# Altium project ARGUSPrjPcb.PrjPcb (part 2 of 2)

## Sheet USB.SchDoc: USB
size A4; DocumentNumber: 15; SheetNumber: 8; SheetTotal: 18
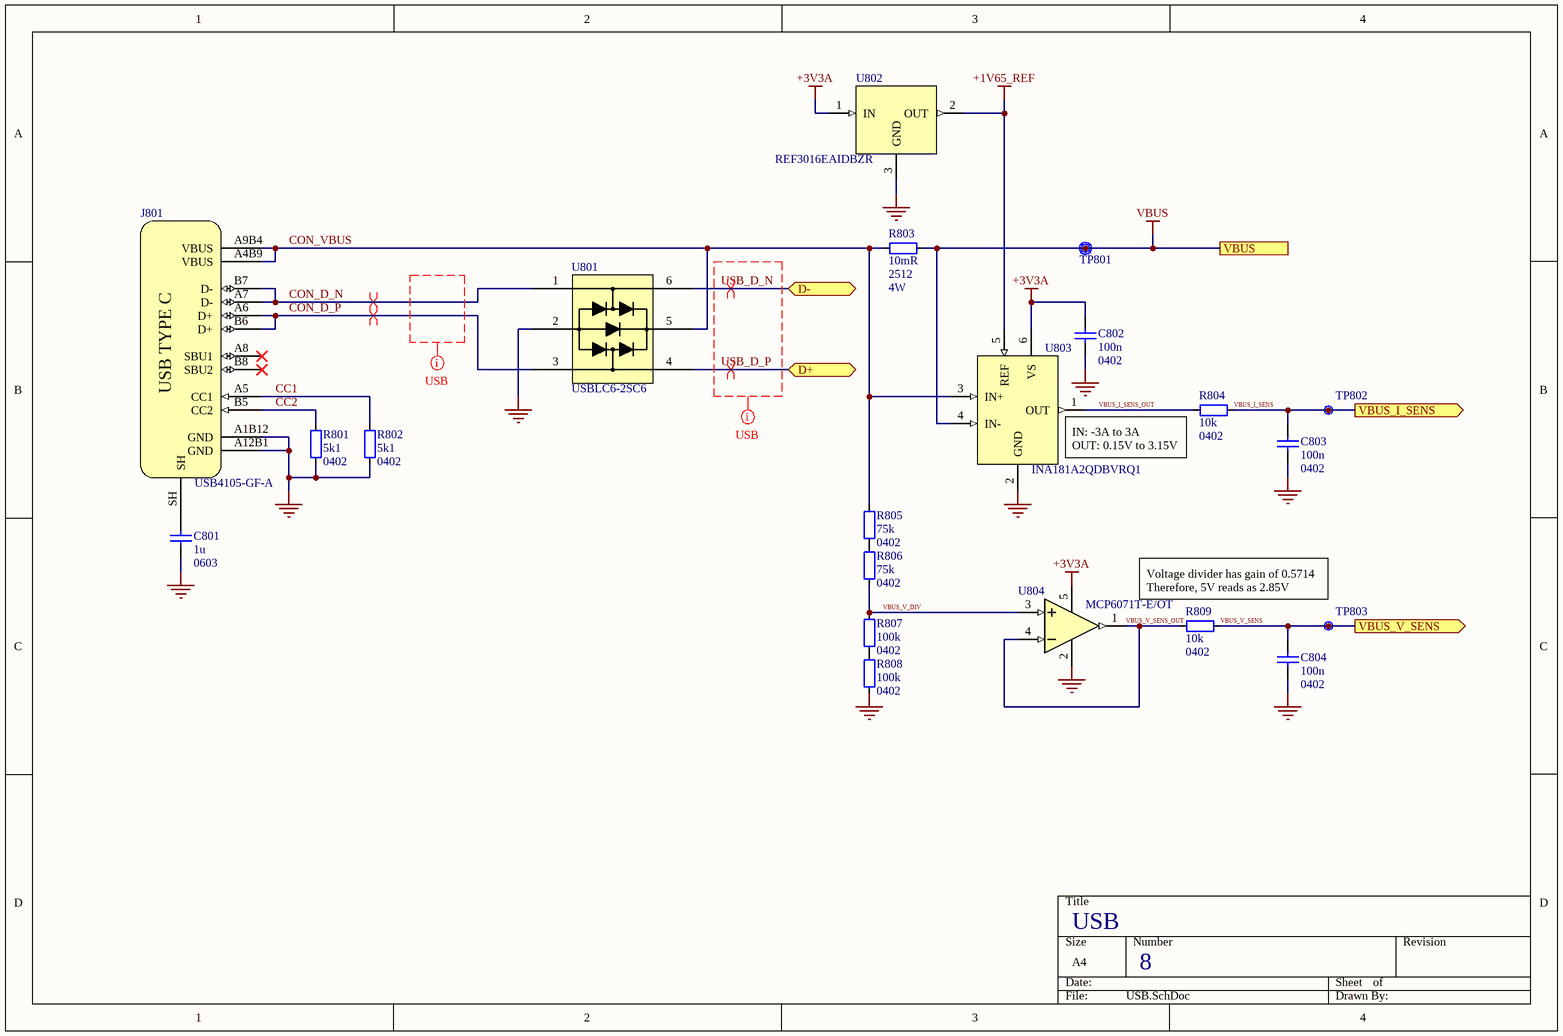
[diagram p9: USB.SchDoc]

### Parts
C801  1u  Footprint: 0603  [CAP_0603_B]
C802  100n  Footprint: 0402  [CAP_0402_B]
C803  100n  Footprint: 0402  [CAP_0402_B]
C804  100n  Footprint: 0402  [CAP_0402_B]
J801  USB4105-GF-A  [USB4105-GF-A]
R801  5k1  Footprint: 0402  [RES_0402_A]
R802  5k1  Footprint: 0402  [RES_0402_A]
R803  10mR  Footprint: 2512  Power: 4W  [VMS-R010-1.0-U]
R804  10k  Footprint: 0402  [RES_0402_A]
R805  75k  Footprint: 0402  [RES_0402_A]
R806  75k  Footprint: 0402  [RES_0402_A]
R807  100k  Footprint: 0402  [RES_0402_A]
R808  100k  Footprint: 0402  [RES_0402_A]
R809  10k  Footprint: 0402  [RES_0402_A]
TP801  Net  [Labelled Testpoint]  (value not drawn)
TP802  Net  [Unlabelled Testpoint]  (value not drawn)
TP803  Net  [Unlabelled Testpoint]  (value not drawn)
U801  USBLC6-2SC6  [USBLC6-2SC6]
U802  REF3016EAIDBZR  [REF3016EAIDBZR]
U803  INA181A2QDBVRQ1  [INA181A2QDBVRQ1]
U804  MCP6071T-E/OT  [MCP6071T-E/OT]

### Ports
D+ (bidir, see Top_Level[3B]), D- (bidir, see Top_Level[3B]), VBUS (see Top_Level[3B], Battery_Charging[1C]), VBUS_I_SENS (out, see Top_Level[3B], Power_Sense[1C]), VBUS_V_SENS (out, see Top_Level[3B], Power_Sense[1C])

### Nets
+1V65_REF: U802.2(OUT) U803.5(REF)
+3V3A: C802.1 U802.1(IN) U803.6(VS) U804.5(VDD)
GND: C801.2 C802.2 C803.2 C804.2 J801.A1B12(GND) J801.A12B1(GND) R801.2(a) R802.2(a) R808.2(a) U801.2(GND) U802.3(GND) U803.2(GND) U804.2(VSS)
VBUS: R803.2(a) TP801.1 U803.4(IN-) ; port VBUS
CC1: J801.A5(CC1) R802.1(a)
CC2: J801.B5(CC2) R801.1(a)
CON_D_N: J801.A7(D-) J801.B7(D-) U801.1(IO1)
CON_D_P: J801.A6(D+) J801.B6(D+) U801.3(IO2)
CON_VBUS: J801.A4B9(VBUS) J801.A9B4(VBUS) R803.1(a) R805.2(a) U801.5(VBUS) U803.3(IN+)
USB_D_N: U801.6(IO1) ; port D-
USB_D_P: U801.4(IO2) ; port D+
VBUS_I_SENS: C803.1 R804.2(a) TP802.1 ; port VBUS_I_SENS
VBUS_I_SENS_OUT: R804.1(a) U803.1(OUT)
VBUS_V_DIV: R806.1(a) R807.1(a) U804.3(VIN+)
VBUS_V_SENS: C804.1 R809.2(a) TP803.1 ; port VBUS_V_SENS
VBUS_V_SENS_OUT: R809.1(a) U804.1(VOUT) U804.4(VIN-)
NetC801_1: C801.1 J801.SH
NetR805_1: R805.1(a) R806.2(a)
NetR807_2: R807.2(a) R808.1(a)

Not connected (* = marked no-connect by the designer): J801 A8(SBU1)* B8(SBU2)*

### Layout directives
differential pair: CON_D_N, CON_D_P, USB_D_N, USB_D_P
net class USB: (no net found under the mark), USB_D_N, USB_D_P

### Notes on the sheet
- (near U803) IN: -3A to 3A
  OUT: 0.15V to 3.15V
- Voltage divider has gain of 0.5714
  Therefore, 5V reads as 2.85V
- (in symbol USB4105-GF-A) USB TYPE C

### Library data of the parts
C801 = CAP_0603: 0603 SMD Capacitor
C802-C804 = CAP_0402: 0402 SMD Capacitor
J801 = USB4105-GF-A: USB-C (USB TYPE-C) USB 2.0 Receptacle Connector 24 (16+8 Dummy) Position Surface Mount, Right Angle; Through Hole; Supplier 1: Future Electronics; Supplier Part Number 1: USB4105-GF-A
R801 R802 R804-R809 = RES_0402: 0402 SMD Resistor
R803 = RES_GENERIC: VMS-R010-1.0-U; Supplier 1: DigiKey; Supplier Part Number 1: 4423-VMS-R010-1.0-UDKR-ND
TP801 = Labelled Testpoint: Symbol for a labelled testpoint
TP802 TP803 = Unlabelled Testpoint: Symbol for an unlabelled testpoint
U801 = USBLC6-2SC6: 17V Clamp 5A (8/20µs) Ipp Tvs Diode Surface Mount SOT-23-6; Supplier 1: Arrow Electronics; Supplier Part Number 1: USBLC6-2SC6
U802 = REF3016EAIDBZR: Series Voltage Reference IC Fixed 1.65V V ±0.1% 25 mA SOT-23-3; Supplier 1: DigiKey; Supplier Part Number 1: 296-REF3016EAIDBZRCT-ND
U803 = INA181A2QDBVRQ1: as U1401 on sheet Battery_Charging; Supplier 1: DigiKey; Supplier Part Number 1: 296-INA181A2QDBVRQ1CT-ND
U804 = MCP6071T-E/OT: as U1404 on sheet Battery_Charging; Supplier 1: Arrow Electronics; Supplier Part Number 1: MCP6071T-E/OT

## Sheet EEPROM.SchDoc: EEPROM
size A4; DocumentNumber: 13; SheetNumber: 11; SheetTotal: 16
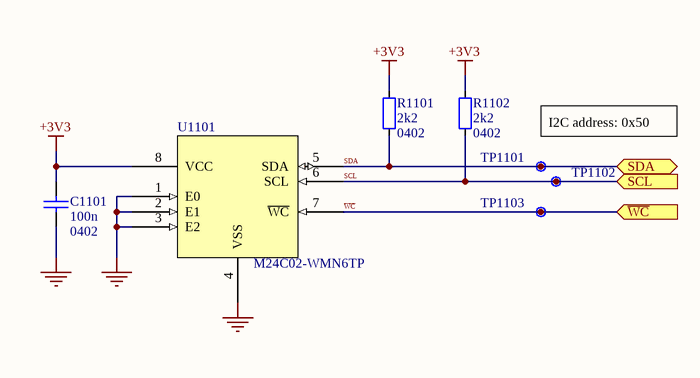
[diagram p10: EEPROM.SchDoc]

### Parts
C1101  100n  Footprint: 0402  [CAP_0402_B]
R1101  2k2  Footprint: 0402  [RES_0402_A]
R1102  2k2  Footprint: 0402  [RES_0402_A]
TP1101  Net  [Unlabelled Testpoint]  (value not drawn)
TP1102  Net  [Unlabelled Testpoint]  (value not drawn)
TP1103  Net  [Unlabelled Testpoint]  (value not drawn)
U1101  M24C02-WMN6TP  [M24C02-WMN6TP]

### Ports
SCL (in, see Top_Level[3D]), SDA (bidir, see Top_Level[3D]), ~{WC} (in, see Top_Level[3D])

### Nets
+3V3: C1101.1 R1101.1(a) R1102.1(a) U1101.8(VCC)
GND: C1101.2 U1101.1(E0) U1101.2(E1) U1101.3(E2) U1101.4(VSS)
SCL: R1102.2(a) TP1102.1 U1101.6(SCL) ; port SCL  [project net EEPROM_SCL]
SDA: R1101.2(a) TP1101.1 U1101.5(SDA) ; port SDA  [project net EEPROM_SDA]
~{WC}: TP1103.1 U1101.7(~{WC}) ; port ~{WC}  [project net EEPROM_~{WC}]

### Notes on the sheet
- I2C address: 0x50

### Library data of the parts
C1101 = CAP_0402: 0402 SMD Capacitor
R1101 R1102 = RES_0402: 0402 SMD Resistor
TP1101-TP1103 = Unlabelled Testpoint: Symbol for an unlabelled testpoint
U1101 = M24C02-WMN6TP: IC EEPROM 2KBIT I2C 400KHZ 8SOIC; Supplier 1: Arrow Electronics; Supplier Part Number 1: M24C02-WMN6TP

## Sheet RTC.SchDoc: RTC
size A4; DocumentNumber: 12; SheetNumber: 10; SheetTotal: 16
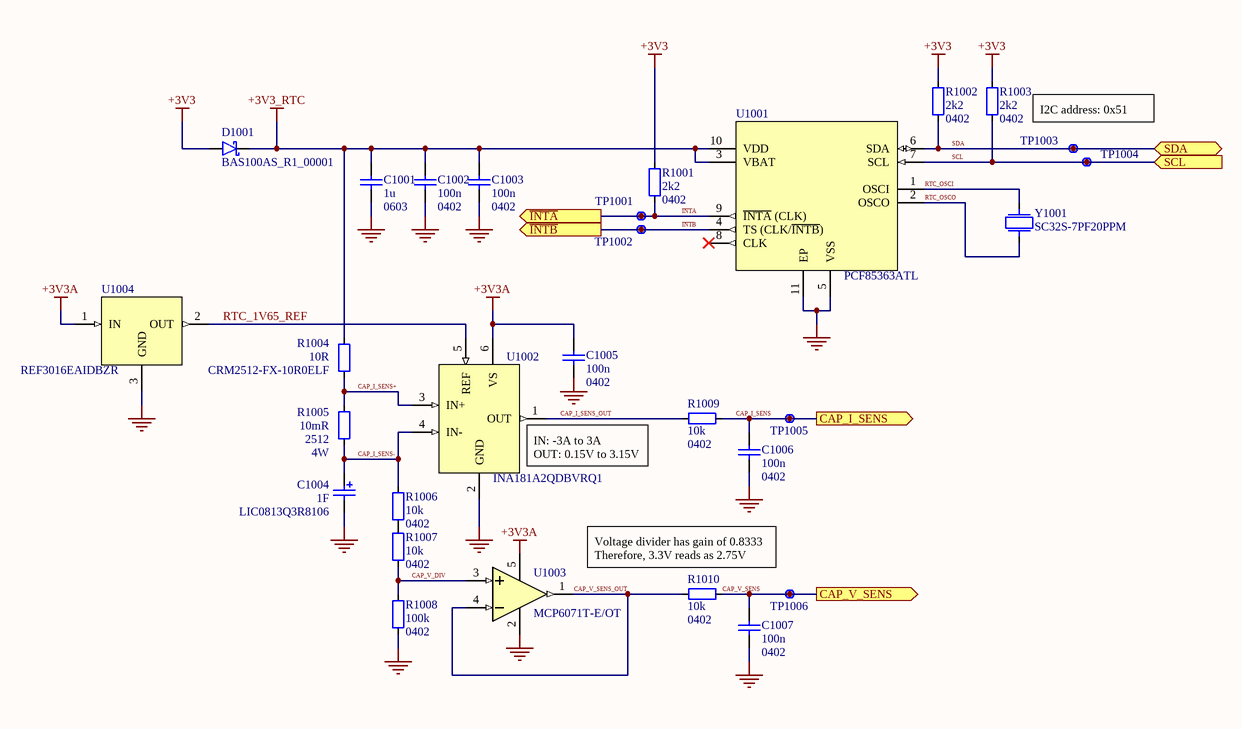
[diagram p11: RTC.SchDoc]

### Parts
C1001  1u  Footprint: 0603  [CAP_0603_B]
C1002  100n  Footprint: 0402  [CAP_0402_B]
C1003  100n  Footprint: 0402  [CAP_0402_B]
C1004  1F  [LIC0813Q3R8106]
C1005  100n  Footprint: 0402  [CAP_0402_B]
C1006  100n  Footprint: 0402  [CAP_0402_B]
C1007  100n  Footprint: 0402  [CAP_0402_B]
D1001  BAS100AS_R1_00001  [BAS100AS_R1_00001]
R1001  2k2  Footprint: 0402  [RES_0402_A]
R1002  2k2  Footprint: 0402  [RES_0402_A]
R1003  2k2  Footprint: 0402  [RES_0402_A]
R1004  10R  [CRM2512-FX-10R0ELF]
R1005  10mR  Footprint: 2512  Power: 4W  [VMS-R010-1.0-U]
R1006  10k  Footprint: 0402  [RES_0402_A]
R1007  10k  Footprint: 0402  [RES_0402_A]
R1008  100k  Footprint: 0402  [RES_0402_A]
R1009  10k  Footprint: 0402  [RES_0402_A]
R1010  10k  Footprint: 0402  [RES_0402_A]
TP1001  Net  [Unlabelled Testpoint]  (value not drawn)
TP1002  Net  [Unlabelled Testpoint]  (value not drawn)
TP1003  Net  [Unlabelled Testpoint]  (value not drawn)
TP1004  Net  [Unlabelled Testpoint]  (value not drawn)
TP1005  Net  [Unlabelled Testpoint]  (value not drawn)
TP1006  Net  [Unlabelled Testpoint]  (value not drawn)
U1001  PCF85363ATL  [PCF85363ATL/AX]
U1002  INA181A2QDBVRQ1  [INA181A2QDBVRQ1]
U1003  MCP6071T-E/OT  [MCP6071T-E/OT]
U1004  REF3016EAIDBZR  [REF3016EAIDBZR]
Y1001  SC32S-7PF20PPM  [SC32S-7PF20PPM]

### Ports
CAP_I_SENS (out, see Top_Level[3C], MCU[2D]), CAP_V_SENS (out, see Top_Level[3C], MCU[2D]), SCL (in, see Top_Level[3B]), SDA (bidir, see Top_Level[3B]), ~{INTA} (out, see Top_Level[3B]), ~{INTB} (out, see Top_Level[3C])

### Nets
+3V3: D1001.1(a) R1001.1(a) R1002.1(a) R1003.1(a)
+3V3_RTC: C1001.1 C1002.1 C1003.1 D1001.2 R1004.1(a) U1001.3(VBAT) U1001.10(VDD)
+3V3A: C1005.1 U1002.6(VS) U1003.5(VDD) U1004.1(IN)
GND: C1001.2 C1002.2 C1003.2 C1004.2 C1005.2 C1006.2 C1007.2 R1008.2(a) U1001.5(VSS) U1001.11(EP) U1002.2(GND) U1003.2(VSS) U1004.3(GND)
CAP_I_SENS: C1006.1 R1009.2(a) TP1005.1 ; port CAP_I_SENS
CAP_I_SENS+: R1004.2(a) R1005.2(a) U1002.3(IN+)
CAP_I_SENS-: C1004.1 R1005.1(a) R1006.1(a) U1002.4(IN-)
CAP_I_SENS_OUT: R1009.1(a) U1002.1(OUT)
CAP_V_DIV: R1007.2(a) R1008.1(a) U1003.3(VIN+)
CAP_V_SENS: C1007.1 R1010.2(a) TP1006.1 ; port CAP_V_SENS
CAP_V_SENS_OUT: R1010.1(a) U1003.1(VOUT) U1003.4(VIN-)
~{INT}A: R1001.2(a) TP1001.1 U1001.9(~{INTA}_(CLK)) ; port ~{INTA}
~{INT}B: TP1002.1 U1001.4(TS_(CLK/~{INTB})) ; port ~{INTB}
RTC_1V65_REF: U1002.5(REF) U1004.2(OUT)
RTC_OSCI: U1001.1(OSCI) Y1001.2
RTC_OSCO: U1001.2(OSCO) Y1001.1
SCL: R1003.2(a) TP1004.1 U1001.7(SCL) ; port SCL  [project net RTC_SCL]
SDA: R1002.2(a) TP1003.1 U1001.6(SDA) ; port SDA  [project net RTC_SDA]
NetR1006_2: R1006.2(a) R1007.1(a)

Not connected (* = marked no-connect by the designer): U1001 8(CLK)*

### Notes on the sheet
- I2C address: 0x51
- (near U1002) IN: -3A to 3A
  OUT: 0.15V to 3.15V
- Voltage divider has gain of 0.8333
  Therefore, 3.3V reads as 2.75V

### Library data of the parts
C1001 = CAP_0603: 0603 SMD Capacitor
C1002 C1003 C1005-C1007 = CAP_0402: 0402 SMD Capacitor
C1004 = CAP_GENERIC_POLARISED: 10 F (EDLC) Supercapacitor 3.8 V Radial, Can 510mOhm @ 1kHz 1000 Hrs @ 85°C; Part Number: LIC0813Q3R8106
D1001 = BAS100AS_R1_00001: DIODE SCHOTTKY 100V 500MA SOD123; Supplier 1: DigiKey; Supplier Part Number 1: 3757-BAS100AS_R1_00001CT-ND
R1001-R1003 R1006-R1010 = RES_0402: 0402 SMD Resistor
R1004 = RES_GENERIC: Generic resistor symbol; Part Number: CRM2512-FX-10R0ELF
R1005 = RES_GENERIC: VMS-R010-1.0-U; Supplier 1: DigiKey; Supplier Part Number 1: 4423-VMS-R010-1.0-UDKR-ND
TP1001-TP1006 = Unlabelled Testpoint: Symbol for an unlabelled testpoint
U1001 = PCF85363ATL: IC RTC CLK/CALENDAR I2C 10DFN; Supplier 1: Arrow Electronics; Supplier Part Number 1: PCF85363ATL/AX
U1002 = INA181A2QDBVRQ1: Current Sense Amplifier 1 Circuit Rail-to-Rail SOT-23-6; Supplier 1: DigiKey; Supplier Part Number 1: 296-INA181A2QDBVRQ1CT-ND
U1003 = MCP6071T-E/OT: Standard (General Purpose) Amplifier 1 Circuit Rail-to-Rail SOT-23-5; Supplier 1: Arrow Electronics; Supplier Part Number 1: MCP6071T-E/OT
U1004 = REF3016EAIDBZR: Series Voltage Reference IC Fixed 1.65V V ±0.1% 25 mA SOT-23-3; Supplier 1: DigiKey; Supplier Part Number 1: 296-REF3016EAIDBZRCT-ND
Y1001 = SC32S-7PF20PPM: 32.768 kHz ±20ppm Crystal 7pF 70 kOhms 2-SMD, No Lead; Supplier 1: Arrow Electronics; Supplier Part Number 1: SC32S-7PF20PPM

## Sheet SD_Card.SchDoc: SD Card
size A4; DocumentNumber: 14; SheetNumber: 12; SheetTotal: 16
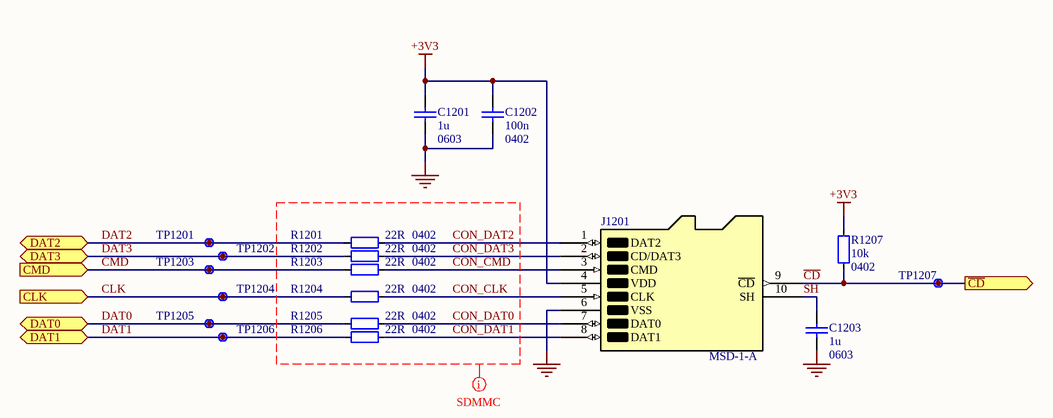
[diagram p12: SD_Card.SchDoc]

### Parts
C1201  1u  Footprint: 0603  [CAP_0603_B]
C1202  100n  Footprint: 0402  [CAP_0402_B]
C1203  1u  Footprint: 0603  [CAP_0603_B]
J1201  MSD-1-A  [MSD-1-A]
R1201  22R  Footprint: 0402  [RES_0402_A]
R1202  22R  Footprint: 0402  [RES_0402_A]
R1203  22R  Footprint: 0402  [RES_0402_A]
R1204  22R  Footprint: 0402  [RES_0402_A]
R1205  22R  Footprint: 0402  [RES_0402_A]
R1206  22R  Footprint: 0402  [RES_0402_A]
R1207  10k  Footprint: 0402  [RES_0402_A]
TP1201  Net  [Unlabelled Testpoint]  (value not drawn)
TP1202  Net  [Unlabelled Testpoint]  (value not drawn)
TP1203  Net  [Unlabelled Testpoint]  (value not drawn)
TP1204  Net  [Unlabelled Testpoint]  (value not drawn)
TP1205  Net  [Unlabelled Testpoint]  (value not drawn)
TP1206  Net  [Unlabelled Testpoint]  (value not drawn)
TP1207  Net  [Unlabelled Testpoint]  (value not drawn)

### Ports
CLK (in, see Top_Level[3C]), CMD (in, see Top_Level[3C]), DAT0 (bidir, see Top_Level[3C]), DAT1 (bidir, see Top_Level[3C]), DAT2 (bidir, see Top_Level[3C]), DAT3 (bidir, see Top_Level[3C]), ~{CD} (out, see Top_Level[3C])

### Nets
+3V3: C1201.1 C1202.1 J1201.4(VDD) R1207.1(a)
GND: C1201.2 C1202.2 C1203.2 J1201.6(VSS)
~{CD}: J1201.9(~{CD}) R1207.2(a) TP1207.1 ; port ~{CD}
CLK: R1204.1(a) TP1204.1 ; port CLK
CMD: R1203.1(a) TP1203.1 ; port CMD
CON_CLK: J1201.5(CLK) R1204.2(a)
CON_CMD: J1201.3(CMD) R1203.2(a)
CON_DAT0: J1201.7(DAT0) R1205.2(a)
CON_DAT1: J1201.8(DAT1) R1206.2(a)
CON_DAT2: J1201.1(DAT2) R1201.2(a)
CON_DAT3: J1201.2(CD/DAT3) R1202.2(a)
DAT0: R1205.1(a) TP1205.1 ; port DAT0
DAT1: R1206.1(a) TP1206.1 ; port DAT1
DAT2: R1201.1(a) TP1201.1 ; port DAT2
DAT3: R1202.1(a) TP1202.1 ; port DAT3
SH: C1203.1 J1201.10(SH)

### Layout directives
net class SDMMC: CON_CLK, CON_CMD, CON_DAT0, CON_DAT1, CON_DAT2, CON_DAT3

### Library data of the parts
C1201 C1203 = CAP_0603: 0603 SMD Capacitor
C1202 = CAP_0402: 0402 SMD Capacitor
J1201 = MSD-1-A: CONN MICROSD CARD R/A SMD; Supplier 1: Arrow Electronics; Supplier Part Number 1: MSD-1-A
R1201-R1207 = RES_0402: 0402 SMD Resistor
TP1201-TP1207 = Unlabelled Testpoint: Symbol for an unlabelled testpoint

## Sheet 5V_Regulator.SchDoc: 5V Regulator
size A4; DocumentNumber: 10; SheetNumber: 15; SheetTotal: 16
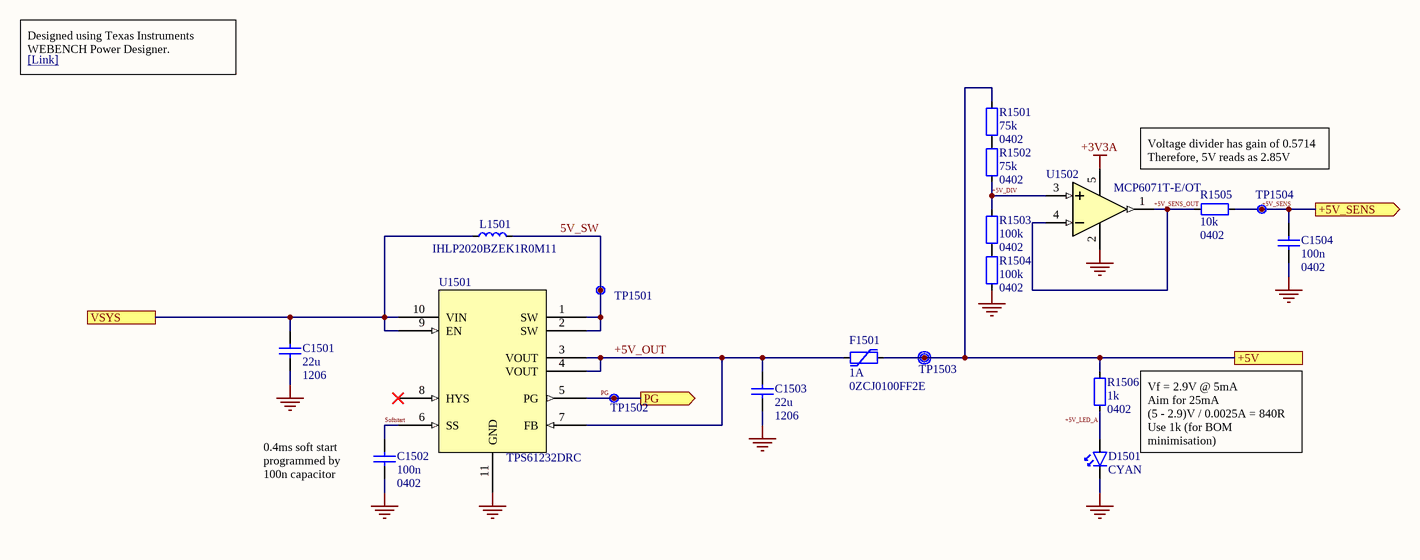
[diagram p13: 5V_Regulator.SchDoc]

### Parts
C1501  22u  Footprint: 1206  [CAP_1206_B]
C1502  100n  Footprint: 0402  [CAP_0402_B]
C1503  22u  Footprint: 1206  [CAP_1206_B]
C1504  100n  Footprint: 0402  [CAP_0402_B]
D1501  CYAN  [SMLD12E3N1WT86]
F1501  1A  [0ZCJ0100FF2E]
L1501  IHLP2020BZEK1R0M11  [IHLP2020BZEK1R0M11]
R1501  75k  Footprint: 0402  [RES_0402_A]
R1502  75k  Footprint: 0402  [RES_0402_A]
R1503  100k  Footprint: 0402  [RES_0402_A]
R1504  100k  Footprint: 0402  [RES_0402_A]
R1505  10k  Footprint: 0402  [RES_0402_A]
R1506  1k  Footprint: 0402  [RES_0402_A]
TP1501  Net  [Unlabelled Testpoint]  (value not drawn)
TP1502  Net  [Unlabelled Testpoint]  (value not drawn)
TP1503  Net  [Labelled Testpoint]  (value not drawn)
TP1504  Net  [Unlabelled Testpoint]  (value not drawn)
U1501  TPS61232DRC  [TPS61232DRCR]
U1502  MCP6071T-E/OT  [MCP6071T-E/OT]

### Ports
+5V (see Top_Level[4B]), +5V_SENS (out, see Top_Level[4B], MCU[2D]), PG (out, see Top_Level[4B]), VSYS (see Top_Level[4B], 3V3_Regulators[1A], Battery_Charging[4C])

### Nets
+3V3A: U1502.5(VDD)
+5V: F1501.2(a) R1501.2(a) R1506.1(a) TP1503.1 ; port +5V
GND: C1501.2 C1502.2 C1503.2 C1504.2 D1501.2 R1504.2(a) U1501.11(GND) U1502.2(VSS)
VSYS: C1501.1 L1501.2(a) U1501.9(EN) U1501.10(VIN) ; port VSYS
5V_SW: L1501.1(a) TP1501.1 U1501.1(SW) U1501.2(SW)
+5V_DIV: R1502.1(a) R1503.1(a) U1502.3(VIN+)
+5V_LED_A: D1501.1 R1506.2(a)
+5V_OUT: C1503.1 F1501.1(a) U1501.3(VOUT) U1501.4(VOUT) U1501.7(FB)
+5V_SENS: C1504.1 R1505.2(a) TP1504.1 ; port +5V_SENS
+5V_SENS_OUT: R1505.1(a) U1502.1(VOUT) U1502.4(VIN-)
PG: TP1502.1 U1501.5(PG) ; port PG
Softstart: C1502.1 U1501.6(SS)
NetR1501_1: R1501.1(a) R1502.2(a)
NetR1503_2: R1503.2(a) R1504.1(a)

Not connected (* = marked no-connect by the designer): U1501 8(HYS)*

### Notes on the sheet
- Designed using Texas Instruments WEBENCH Power Designer.
- [Link] <https://webench.ti.com/appinfo/webench/scripts/SDP.cgi?ID=AD256845D1460620>
- Voltage divider has gain of 0.5714
  Therefore, 5V reads as 2.85V
- Vf = 2.9V @ 5mA
  Aim for 25mA
  (5 - 2.9)V / 0.0025A = 840R
  Use 1k (for BOM minimisation)
- (near C1502) 0.4ms soft start programmed by 100n capacitor

### Library data of the parts
C1501 C1503 = CAP_1206: 1206 SMD Capacitor
C1502 C1504 = CAP_0402: 0402 SMD Capacitor
D1501 = LED_Generic: Part Number: SMLD12E3N1WT86; Supplier 1: DigiKey; Supplier Part Number 1: SMLD12E3N1WT86CT-ND
F1501 = FUSE_GENERIC: Generic Fuse Symbol; Part Number: 0ZCJ0100FF2E; Supplier 1: Avnet; Supplier Part Number 1: 48AC8418
L1501 = IND_GENERIC: 1 µH Shielded Molded Inductor 7.5 A 18.1mOhm Max Nonstandard; Supplier 1: Arrow Electronics; Supplier Part Number 1: IHLP2020BZER1R0M11
R1501-R1506 = RES_0402: 0402 SMD Resistor
TP1501 TP1502 TP1504 = Unlabelled Testpoint: Symbol for an unlabelled testpoint
TP1503 = Labelled Testpoint: Symbol for a labelled testpoint
U1501 = TPS61232DRC: Boost Switching Regulator IC Positive Fixed 5V 1 Output 5A (Switch) 10-VFDFN Exposed Pad; Supplier 1: DigiKey; Supplier Part Number 1: 296-44498-6-ND
U1502 = MCP6071T-E/OT: as U1003 on sheet RTC; Supplier 1: Arrow Electronics; Supplier Part Number 1: MCP6071T-E/OT

## Sheet 3V3_Regulators.SchDoc: 3V3 Regulator
size A4; DocumentNumber: 11; SheetNumber: 16; SheetTotal: 17
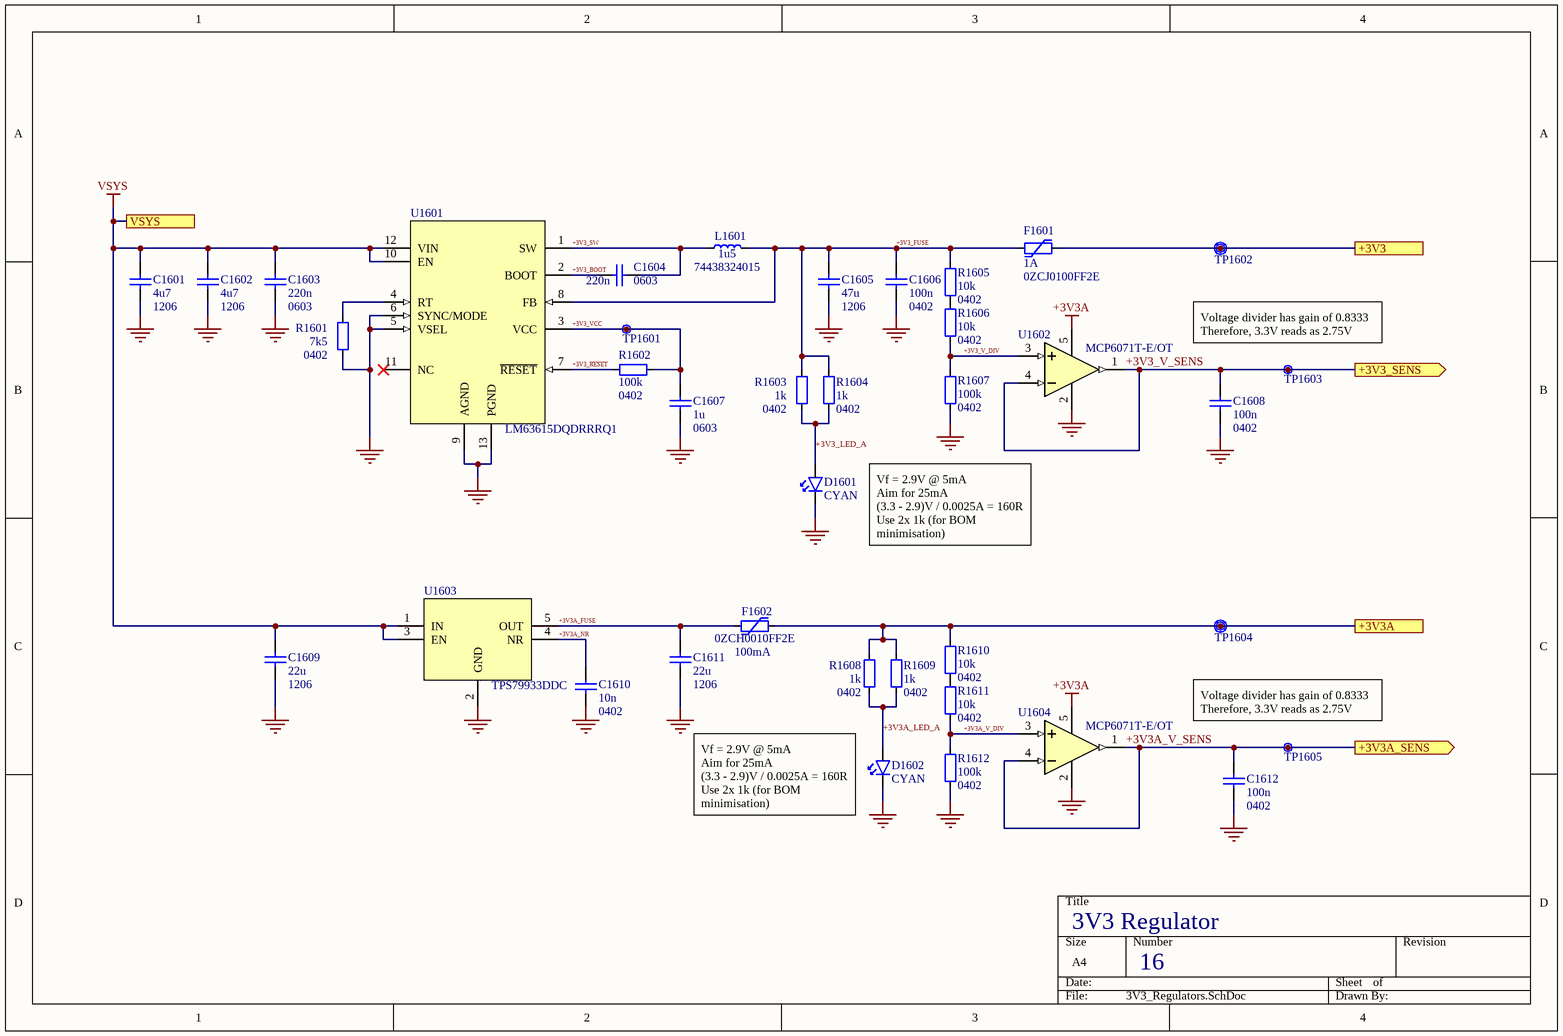
[diagram p14: 3V3_Regulators.SchDoc]

### Parts
C1601  4u7  Footprint: 1206  [CAP_1206_B]
C1602  4u7  Footprint: 1206  [CAP_1206_B]
C1603  220n  Footprint: 0603  [CAP_0603_B]
C1604  220n  Footprint: 0603  [CAP_0603_B]
C1605  47u  Footprint: 1206  [CAP_1206_B]
C1606  100n  Footprint: 0402  [CAP_0402_B]
C1607  1u  Footprint: 0603  [CAP_0603_B]
C1608  100n  Footprint: 0402  [CAP_0402_B]
C1609  22u  Footprint: 1206  [CAP_1206_B]
C1610  10n  Footprint: 0402  [CAP_0402_B]
C1611  22u  Footprint: 1206  [CAP_1206_B]
C1612  100n  Footprint: 0402  [CAP_0402_B]
D1601  CYAN  [SMLD12E3N1WT86]
D1602  CYAN  [SMLD12E3N1WT86]
F1601  1A  [0ZCJ0100FF2E]
F1602  100mA  [0ZCH0010FF2E]
L1601  1u5  [74438324015]
R1601  7k5  Footprint: 0402  [RES_0402_A]
R1602  100k  Footprint: 0402  [RES_0402_A]
R1603  1k  Footprint: 0402  [RES_0402_A]
R1604  1k  Footprint: 0402  [RES_0402_A]
R1605  10k  Footprint: 0402  [RES_0402_A]
R1606  10k  Footprint: 0402  [RES_0402_A]
R1607  100k  Footprint: 0402  [RES_0402_A]
R1608  1k  Footprint: 0402  [RES_0402_A]
R1609  1k  Footprint: 0402  [RES_0402_A]
R1610  10k  Footprint: 0402  [RES_0402_A]
R1611  10k  Footprint: 0402  [RES_0402_A]
R1612  100k  Footprint: 0402  [RES_0402_A]
TP1601  Net  [Unlabelled Testpoint]  (value not drawn)
TP1602  Net  [Labelled Testpoint]  (value not drawn)
TP1603  Net  [Unlabelled Testpoint]  (value not drawn)
TP1604  Net  [Labelled Testpoint]  (value not drawn)
TP1605  Net  [Unlabelled Testpoint]  (value not drawn)
U1601  LM63615DQDRRRQ1  [LM63615DQDRRRQ1]
U1602  MCP6071T-E/OT  [MCP6071T-E/OT]
U1603  TPS79933DDC  [TPS79933DDCR]
U1604  MCP6071T-E/OT  [MCP6071T-E/OT]

### Ports
+3V3 (see Top_Level[4C]), +3V3_SENS (out, see Top_Level[4C], Power_Sense[1C]), +3V3A (see Top_Level[4C]), +3V3A_SENS (out, see Top_Level[4C], Power_Sense[1C]), VSYS (see Top_Level[4C], 5V_Regulator[1B], Battery_Charging[4C])

### Nets
+3V3: F1601.2(a) TP1602.1 ; port +3V3
+3V3A: F1602.2(a) R1608.1(a) R1609.1(a) R1610.1(a) TP1604.1 U1602.5(VDD) U1604.5(VDD) ; port +3V3A
GND: C1601.2 C1602.2 C1603.2 C1605.2 C1606.2 C1607.2 C1608.2 C1609.2 C1610.2 C1611.2 C1612.2 D1601.2 D1602.2 R1601.2(a) R1607.2(a) R1612.2(a) U1601.5(VSEL) U1601.6(SYNC/MODE) U1601.9(AGND) U1601.13(PGND) U1602.2(VSS) U1603.2(GND) U1604.2(VSS)
VSYS: C1601.1 C1602.1 C1603.1 C1609.1 U1601.10(EN) U1601.12(VIN) U1603.1(IN) U1603.3(EN) ; port VSYS
+3V3_BOOT: C1604.1 U1601.2(BOOT)
+3V3_FUSE: C1605.1 C1606.1 F1601.1(a) L1601.1(a) R1603.1(a) R1604.1(a) R1605.1(a) U1601.8(FB)
+3V3_LED_A: D1601.1 R1603.2(a) R1604.2(a)
+3V3_~{RESET}: R1602.1(a) U1601.7(~{RESET})
+3V3_SW: C1604.2 L1601.2(a) U1601.1(SW)
+3V3_V_DIV: R1606.2(a) R1607.1(a) U1602.3(VIN+)
+3V3_V_SENS: C1608.1 TP1603.1 U1602.1(VOUT) U1602.4(VIN-) ; port +3V3_SENS
+3V3_VCC: C1607.1 R1602.2(a) TP1601.1 U1601.3(VCC)
+3V3A_FUSE: C1611.1 F1602.1(a) U1603.5(OUT)
+3V3A_LED_A: D1602.1 R1608.2(a) R1609.2(a)
+3V3A_NR: C1610.1 U1603.4(NR)
+3V3A_V_DIV: R1611.2(a) R1612.1(a) U1604.3(VIN+)
+3V3A_V_SENS: C1612.1 TP1605.1 U1604.1(VOUT) U1604.4(VIN-) ; port +3V3A_SENS
NetR1601_1: R1601.1(a) U1601.4(RT)
NetR1605_2: R1605.2(a) R1606.1(a)
NetR1610_2: R1610.2(a) R1611.1(a)

Not connected (* = marked no-connect by the designer): U1601 11(NC)*

### Notes on the sheet
- (near TP1603) Voltage divider has gain of 0.8333
  Therefore, 3.3V reads as 2.75V
- Vf = 2.9V @ 5mA
  Aim for 25mA
  (3.3 - 2.9)V / 0.0025A = 160R
  Use 2x 1k (for BOM minimisation)
- (near TP1605) Voltage divider has gain of 0.8333
  Therefore, 3.3V reads as 2.75V
- (near D1602) Vf = 2.9V @ 5mA
  Aim for 25mA
  (3.3 - 2.9)V / 0.0025A = 160R
  Use 2x 1k (for BOM minimisation)

### Library data of the parts
C1601 C1602 C1605 C1609 C1611 = CAP_1206: 1206 SMD Capacitor
C1603 C1604 C1607 = CAP_0603: 0603 SMD Capacitor
C1606 C1608 C1610 C1612 = CAP_0402: 0402 SMD Capacitor
D1601 D1602 = LED_Generic: Part Number: SMLD12E3N1WT86; Supplier 1: DigiKey; Supplier Part Number 1: SMLD12E3N1WT86CT-ND
F1601 F1602 = FUSE_GENERIC: Generic Fuse Symbol; Supplier 1: Avnet
  F1601: Part Number: 0ZCJ0100FF2E; Supplier Part Number 1: 48AC8418
  F1602: Part Number: 0ZCH0010FF2E; Supplier Part Number 1: 48AC8402
L1601 = IND_GENERIC: Generic inductor symbol; Part Number: 74438324015
R1601-R1612 = RES_0402: 0402 SMD Resistor
TP1601 TP1603 TP1605 = Unlabelled Testpoint: Symbol for an unlabelled testpoint
TP1602 TP1604 = Labelled Testpoint: Symbol for a labelled testpoint
U1601 = LM63615DQDRRRQ1: Buck Switching Regulator IC Positive Adjustable 1V 1 Output 1.5A 12-WFDFN Exposed Pad; Supplier 1: DigiKey; Supplier Part Number 1: 296-LM63615DQDRRRQ1DKR-ND
U1602 U1604 = MCP6071T-E/OT: as U1003 on sheet RTC; Supplier 1: Arrow Electronics; Supplier Part Number 1: MCP6071T-E/OT
U1603 = TPS79933DDC: Linear Voltage Regulator IC Positive Fixed 1 Output 200mA SOT-23-THIN; Supplier 1: DigiKey; Supplier Part Number 1: 296-17783-6-ND

## Sheet ESP32.SchDoc: ESP32
size A4; DocumentNumber: 8; SheetNumber: 9; SheetTotal: 17
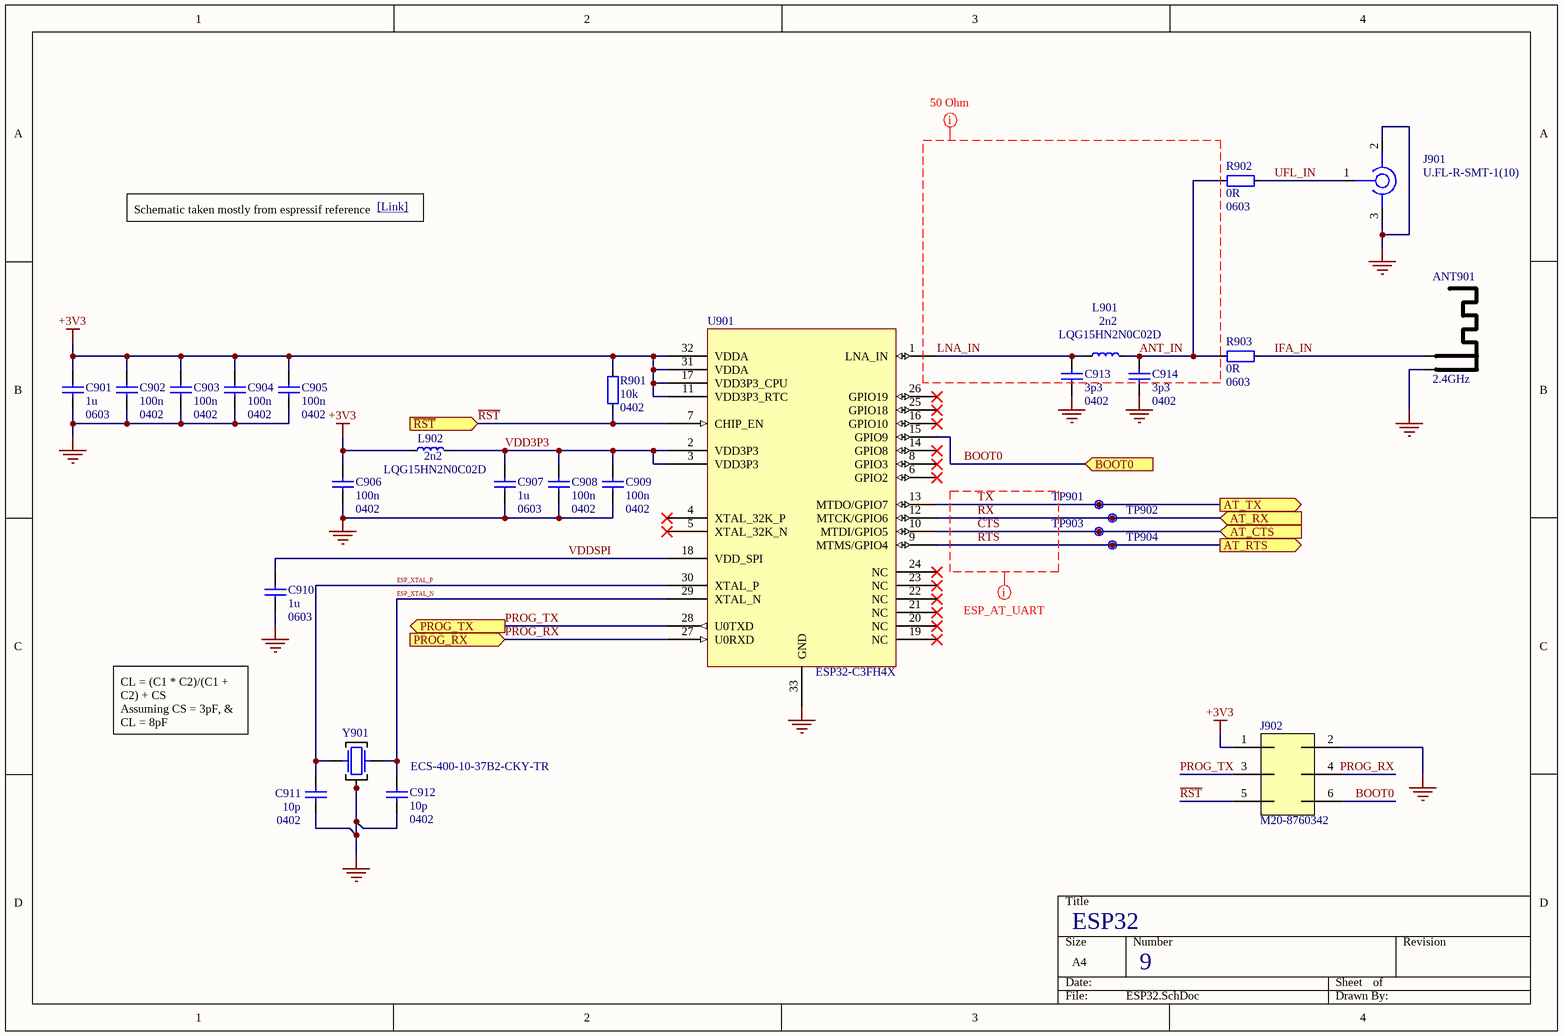
[diagram p15: ESP32.SchDoc]

### Parts
ANT901  2.4GHz  [Meandering_Inverted_F_Antenna]  (net tie, no BOM)
C901  1u  Footprint: 0603  [CAP_0603_B]
C902  100n  Footprint: 0402  [CAP_0402_B]
C903  100n  Footprint: 0402  [CAP_0402_B]
C904  100n  Footprint: 0402  [CAP_0402_B]
C905  100n  Footprint: 0402  [CAP_0402_B]
C906  100n  Footprint: 0402  [CAP_0402_B]
C907  1u  Footprint: 0603  [CAP_0603_B]
C908  100n  Footprint: 0402  [CAP_0402_B]
C909  100n  Footprint: 0402  [CAP_0402_B]
C910  1u  Footprint: 0603  [CAP_0603_B]
C911  10p  Footprint: 0402  [CAP_0402_B]
C912  10p  Footprint: 0402  [CAP_0402_B]
C913  3p3  Footprint: 0402  [CAP_0402_B]
C914  3p3  Footprint: 0402  [CAP_0402_B]
J901  U.FL-R-SMT-1(10)  [U.FL-R-SMT-1(80)]
J902  M20-8760342  [M20-8760342]
L901  2n2  [LQG15HN2N0C02D]
L902  2n2  [LQG15HN2N0C02D]
R901  10k  Footprint: 0402  [RES_0402_A]
R902  0R  Footprint: 0603  [RES_0603_A]
R903  0R  Footprint: 0603  [RES_0603_A]
TP901  Net  [Unlabelled Testpoint]  (value not drawn)
TP902  Net  [Unlabelled Testpoint]  (value not drawn)
TP903  Net  [Unlabelled Testpoint]  (value not drawn)
TP904  Net  [Unlabelled Testpoint]  (value not drawn)
U901  ESP32-C3FH4X  [ESP32-C3FH4X]
Y901  ECS-400-10-37B2-CKY-TR  [ECS-400-10-37B2-CKY-TR]

### Ports
AT_CTS (in, see Top_Level[1D], MCU[3C]), AT_RTS (out, see Top_Level[1D], MCU[3C]), AT_RX (in, see Top_Level[1D], MCU[3D]), AT_TX (out, see Top_Level[1D], MCU[3D]), BOOT0 (in, see Top_Level[1D]), PROG_RX (in, see Top_Level[1D]), PROG_TX (out, see Top_Level[1D]), ~{RST} (in, see Top_Level[1D])

### Nets
+3V3: C901.1 C902.1 C903.1 C904.1 C905.1 C906.1 J902.1 L902.2(a) R901.1(a) U901.11(VDD3P3_RTC) U901.17(VDD3P3_CPU) U901.31(VDDA) U901.32(VDDA)
GND: ANT901.1(GND) C901.2 C902.2 C903.2 C904.2 C905.2 C906.2 C907.2 C908.2 C909.2 C910.2 C911.2 C912.2 C913.2 C914.2 J901.2(GND) J901.3(GND) J902.2 U901.33(GND) Y901.2(GND) Y901.4(GND)
ANT_IN: C914.1 L901.1(a) R902.1(a) R903.1(a)
BOOT0: J902.6 U901.15(GPIO9) ; port BOOT0
CTS: TP903.1 U901.10(MTDI/GPIO5) ; port AT_CTS  [project net AT_CTS]
ESP_XTAL_N: C912.1 U901.29(XTAL_N) Y901.1(IO)
ESP_XTAL_P: C911.1 U901.30(XTAL_P) Y901.3(IO)
IFA_IN: ANT901.2(FEED) R903.2(a)
LNA_IN: C913.1 L901.2(a) U901.1(LNA_IN)
PROG_RX: J902.4 U901.27(U0RXD) ; port PROG_RX  [project net ESP_PROG_RX]
PROG_TX: J902.3 U901.28(U0TXD) ; port PROG_TX  [project net ESP_PROG_TX]
~{RST}: J902.5 R901.2(a) U901.7(CHIP_EN) ; port ~{RST}  [project net ESP_~{RST}]
RTS: TP904.1 U901.9(MTMS/GPIO4) ; port AT_RTS  [project net AT_RTS]
RX: TP902.1 U901.12(MTCK/GPIO6) ; port AT_RX  [project net AT_RX]
TX: TP901.1 U901.13(MTDO/GPIO7) ; port AT_TX  [project net AT_TX]
UFL_IN: J901.1(SIG) R902.2(a)
VDD3P3: C907.1 C908.1 C909.1 L902.1(a) U901.2(VDD3P3) U901.3(VDD3P3)
VDDSPI: C910.1 U901.18(VDD_SPI)

Not connected (* = marked no-connect by the designer): U901 4(XTAL_32K_P)* 5(XTAL_32K_N)* 6(GPIO2)* 8(GPIO3)* 14(GPIO8)* 16(GPIO10)* 19(NC)* 20(NC)* 21(NC)* 22(NC)* 23(NC)* 24(NC)* 25(GPIO18)* 26(GPIO19)*

### Layout directives
mark named ESP_AT_UART: CTS, RTS, RX, TX
net class 50Ohm: ANT_IN, LNA_IN

### Notes on the sheet
- Schematic taken mostly from espressif reference
- [Link] <https://docs.espressif.com/projects/esp-hardware-design-guidelines/en/latest/esp32c3/schematic-checklist.html>
- CL = (C1 * C2)/(C1 + C2) + CS
  Assuming CS = 3pF, & CL = 8pF
  C2 = C1 = 10pF

### Library data of the parts
ANT901 = Meandering_Inverted_F_Antenna: 2.4GHz meandering inverted F antenna. Taken from Texas Instruments AN043.
C901 C907 C910 = CAP_0603: 0603 SMD Capacitor
C902-C906 C908 C909 C911-C914 = CAP_0402: 0402 SMD Capacitor
J901 = U.FL-R-SMT-1(10): U.FL (UMCC) Connector Receptacle, Male Pin 50 Ohms Surface Mount Solder; Supplier 1: Future Electronics; Supplier Part Number 1: U.FL-R-SMT-1(10)
J902 = M20-8760342: Connector Header Surface Mount 6 position 0.100" (2.54mm); Supplier 1: DigiKey; Supplier Part Number 1: 952-1922-ND
L901 L902 = IND_GENERIC: LQG15HN2N0C02D; Part Number: LQG15HN2N0C02D
R901 = RES_0402: 0402 SMD Resistor
R902 R903 = RES_0603: 0603 SMD Resistor
TP901-TP904 = Unlabelled Testpoint: Symbol for an unlabelled testpoint
U901 = ESP32-C3FH4X: ESP32-C3FH4X IS AN LOW-POWER AND; Supplier 1: DigiKey; Supplier Part Number 1: 1965-ESP32-C3FH4XCT-ND
Y901 = ECS-400-10-37B2-CKY-TR: 40 MHz ±10ppm Crystal 10pF 40 Ohms 4-SMD, No Lead; Supplier 1: Future Electronics; Supplier Part Number 1: ECS-400-10-37B2-CKY-TR

## Sheet Power_Sense.SchDoc: Power Sense
size A4; SheetNumber: 17; SheetTotal: 18
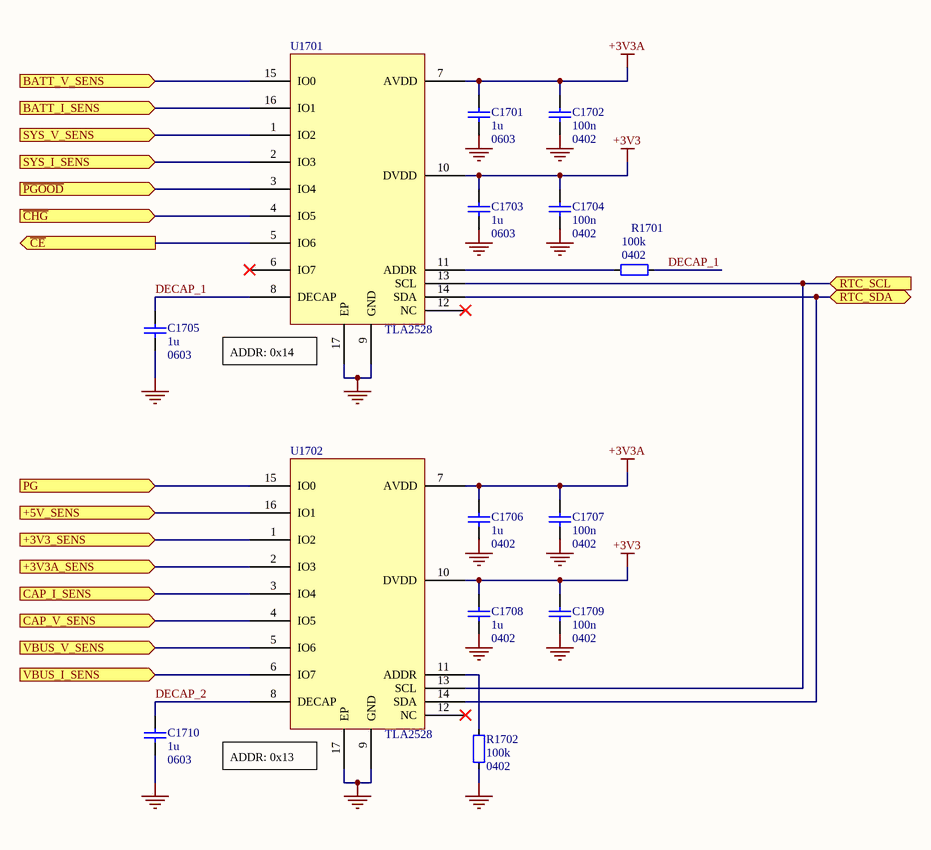
[diagram p16: Power_Sense.SchDoc]

### Parts
C1701  1u  Footprint: 0603  [CAP_0603_B]
C1702  100n  Footprint: 0402  [CAP_0402_B]
C1703  1u  Footprint: 0603  [CAP_0603_B]
C1704  100n  Footprint: 0402  [CAP_0402_B]
C1705  1u  Footprint: 0603  [CAP_0603_B]
C1706  1u  Footprint: 0402  [CAP_0402_B]
C1707  100n  Footprint: 0402  [CAP_0402_B]
C1708  1u  Footprint: 0402  [CAP_0402_B]
C1709  100n  Footprint: 0402  [CAP_0402_B]
C1710  1u  Footprint: 0603  [CAP_0603_B]
R1701  100k  Footprint: 0402  [RES_0402_A]
R1702  100k  Footprint: 0402  [RES_0402_A]
U1701  TLA2528  [TLA2528]
U1702  TLA2528  [TLA2528]

### Ports
+3V3_SENS (in, see Top_Level[3A], 3V3_Regulators[4B]), +3V3A_SENS (in, see Top_Level[3A], 3V3_Regulators[4C]), +5V_SENS (in, see Top_Level[3A], 5V_Regulator[4B]), BATT_I_SENS (in, see Top_Level[3A], Battery_Charging[1A]), BATT_V_SENS (in, see Top_Level[3A], Battery_Charging[1B]), CAP_I_SENS (in, see Top_Level[3B], RTC[3C]), CAP_V_SENS (in, see Top_Level[3B], RTC[3C]), PG (in, see Top_Level[3A], 5V_Regulator[2B]), RTC_SCL (in, see Top_Level[3A], MCU[4C]), RTC_SDA (bidir, see Top_Level[3A], MCU[4C]), SYS_I_SENS (in, see Top_Level[3A], Battery_Charging[4A]), SYS_V_SENS (in, see Top_Level[3A], Battery_Charging[4B]), VBUS_I_SENS (in, see Top_Level[3B], USB[4B]), VBUS_V_SENS (in, see Top_Level[3B], USB[4C]), ~{CE} (out, see Top_Level[3A], Battery_Charging[3C]), ~{CHG} (in, see Top_Level[3A], Battery_Charging[4D]), ~{PGOOD} (in, see Top_Level[3A], Battery_Charging[4D])

### Nets
+3V3: C1703.1 C1704.1 C1708.1 C1709.1 U1701.10(DVDD) U1702.10(DVDD)
+3V3A: C1701.1 C1702.1 C1706.1 C1707.1 U1701.7(AVDD) U1702.7(AVDD)
GND: C1701.2 C1702.2 C1703.2 C1704.2 C1705.2 C1706.2 C1707.2 C1708.2 C1709.2 C1710.2 R1702.2(a) U1701.9(GND) U1701.17(EP) U1702.9(GND) U1702.17(EP)
+3V3_V_SENS: U1702.1(IO2) ; port +3V3_SENS
+3V3A_V_SENS: U1702.2(IO3) ; port +3V3A_SENS
+5V_SENS: U1702.16(IO1) ; port +5V_SENS
BATT_I_SENS: U1701.16(IO1) ; port BATT_I_SENS
BATT_V_SENS: U1701.15(IO0) ; port BATT_V_SENS
~{CE}: U1701.5(IO6) ; port ~{CE}
~{CHG}: U1701.4(IO5) ; port ~{CHG}
CAP_I_SENS: U1702.3(IO4) ; port CAP_I_SENS
CAP_V_SENS: U1702.4(IO5) ; port CAP_V_SENS
DECAP_1: C1705.1 R1701.2(a) U1701.8(DECAP)
DECAP_2: C1710.1 U1702.8(DECAP)
~{PGOOD}: U1701.3(IO4) ; port ~{PGOOD}
PG: U1702.15(IO0) ; port PG
RTC_SCL: U1701.13(SCL) U1702.13(SCL) ; port RTC_SCL
RTC_SDA: U1701.14(SDA) U1702.14(SDA) ; port RTC_SDA
SYS_I_SENS: U1701.2(IO3) ; port SYS_I_SENS
SYS_V_SENS: U1701.1(IO2) ; port SYS_V_SENS
VBUS_I_SENS: U1702.6(IO7) ; port VBUS_I_SENS
VBUS_V_SENS: U1702.5(IO6) ; port VBUS_V_SENS
NetR1701_1: R1701.1(a) U1701.11(ADDR)
NetR1702_1: R1702.1(a) U1702.11(ADDR)

Not connected (* = marked no-connect by the designer): U1701 6(IO7)* 12(NC)*; U1702 12(NC)*

### Notes on the sheet
- (near U1701) ADDR: 0x14
- (near U1702) ADDR: 0x13

### Library data of the parts
C1701 C1703 C1705 C1710 = CAP_0603: 0603 SMD Capacitor
C1702 C1704 C1706-C1709 = CAP_0402: 0402 SMD Capacitor
R1701 R1702 = RES_0402: 0402 SMD Resistor
U1701 U1702 = TLA2528: 12 Bit Analog to Digital Converter 8 Input 1 SAR 16-WQFN (3x3); Supplier 1: Mouser; Supplier Part Number 1: 595-TLA2528IRTER

## Sheet Encoders.SchDoc: Encoders
size A4; SheetNumber: 18; SheetTotal: 18
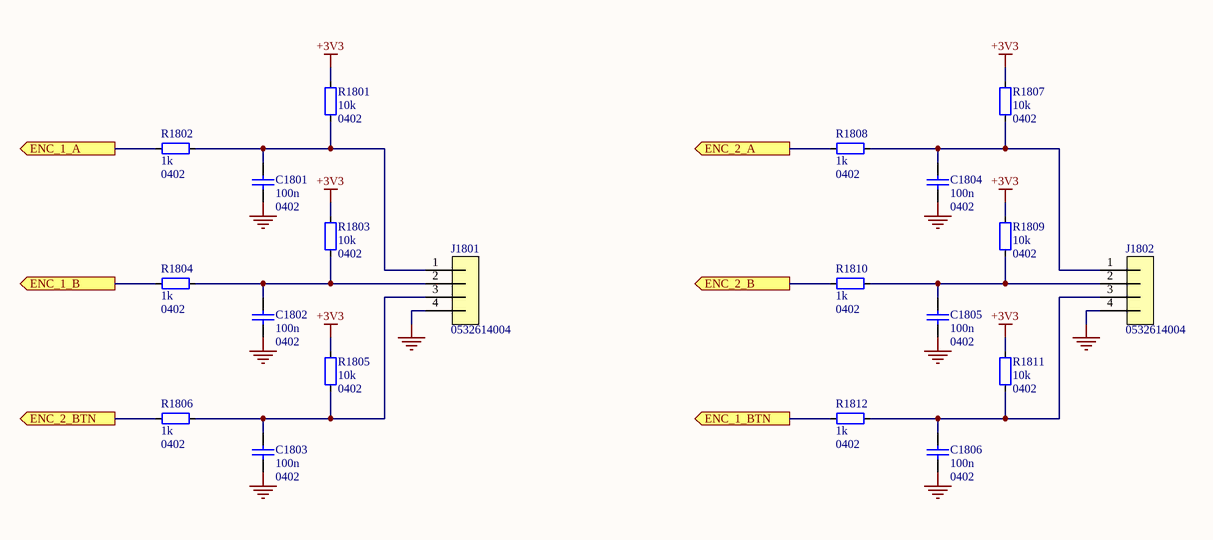
[diagram p17: Encoders.SchDoc]

### Parts
C1801  100n  Footprint: 0402  [CAP_0402_B]
C1802  100n  Footprint: 0402  [CAP_0402_B]
C1803  100n  Footprint: 0402  [CAP_0402_B]
C1804  100n  Footprint: 0402  [CAP_0402_B]
C1805  100n  Footprint: 0402  [CAP_0402_B]
C1806  100n  Footprint: 0402  [CAP_0402_B]
J1801  0532614004  [0532614004]
J1802  0532614004  [0532614004]
R1801  10k  Footprint: 0402  [RES_0402_A]
R1802  1k  Footprint: 0402  [RES_0402_A]
R1803  10k  Footprint: 0402  [RES_0402_A]
R1804  1k  Footprint: 0402  [RES_0402_A]
R1805  10k  Footprint: 0402  [RES_0402_A]
R1806  1k  Footprint: 0402  [RES_0402_A]
R1807  10k  Footprint: 0402  [RES_0402_A]
R1808  1k  Footprint: 0402  [RES_0402_A]
R1809  10k  Footprint: 0402  [RES_0402_A]
R1810  1k  Footprint: 0402  [RES_0402_A]
R1811  10k  Footprint: 0402  [RES_0402_A]
R1812  1k  Footprint: 0402  [RES_0402_A]

### Ports
ENC_1_A (out, see Top_Level[2A], MCU[2D]), ENC_1_B (out, see Top_Level[2A], MCU[2D]), ENC_1_BTN (out, see Top_Level[2A], MCU[2D]), ENC_2_A (out, see Top_Level[2A], MCU[2D]), ENC_2_B (out, see Top_Level[2A], MCU[2D]), ENC_2_BTN (out, see Top_Level[2A], MCU[2D])

### Nets
+3V3: R1801.1(a) R1803.1(a) R1805.1(a) R1807.1(a) R1809.1(a) R1811.1(a)
GND: C1801.2 C1802.2 C1803.2 C1804.2 C1805.2 C1806.2 J1801.4 J1802.4
ENC_1_A: R1802.1(a) ; port ENC_1_A
ENC_1_B: R1804.1(a) ; port ENC_1_B
ENC_1_BTN: R1812.1(a) ; port ENC_1_BTN
ENC_2_A: R1808.1(a) ; port ENC_2_A
ENC_2_B: R1810.1(a) ; port ENC_2_B
ENC_2_BTN: R1806.1(a) ; port ENC_2_BTN
NetC1801_1: C1801.1 J1801.1 R1801.2(a) R1802.2(a)
NetC1802_1: C1802.1 J1801.2 R1803.2(a) R1804.2(a)
NetC1803_1: C1803.1 J1801.3 R1805.2(a) R1806.2(a)
NetC1804_1: C1804.1 J1802.1 R1807.2(a) R1808.2(a)
NetC1805_1: C1805.1 J1802.2 R1809.2(a) R1810.2(a)
NetC1806_1: C1806.1 J1802.3 R1811.2(a) R1812.2(a)

### Library data of the parts
C1801-C1806 = CAP_0402: 0402 SMD Capacitor
J1801 J1802 = 0532614004: Connector Header Surface Mount, Right Angle 4 position 0.049" (1.25mm); Supplier 1: Arrow Electronics; Supplier Part Number 1: 0532614004
R1801-R1812 = RES_0402: 0402 SMD Resistor

## Nets that join several sheets
+1V65_REF: Battery_Charging (TP1401.1 U1401.5 U1403.5), USB (U802.2 U803.5)
+3V3: MCU_Peripherals (D401.4 J401.1 R401.2 SW402.2), MCU_Power (37 pins), LCD (7 pins), SDRAM (15 pins), ADC (C601.1 C602.1 U601.26), EEPROM (C1101.1 R1101.1 R1102.1 U1101.8), RTC (D1001.1 R1001.1 R1002.1 R1003.1), SD_Card (C1201.1 C1202.1 J1201.4 R1207.1), 3V3_Regulators (F1601.2 TP1602.1), ESP32 (13 pins), Power_Sense (6 pins), Encoders (6 pins)
+3V3A: MCU_Power (6 pins), ADC (C603.1 C604.1 U601.15), Battery_Charging (U1401.6 U1403.6 U1404.5 U1405.5), USB (C802.1 U802.1 U803.6 U804.5), RTC (C1005.1 U1002.6 U1003.5 U1004.1), 5V_Regulator (U1502.5), 3V3_Regulators (7 pins), Power_Sense (6 pins)
+5V: LCD (5 pins), 5V_Regulator (F1501.2 R1501.2 R1506.1 TP1503.1)
GND: Top_Level (MH101.1 MH102.1 MH103.1 MH104.1), MCU_Peripherals (12 pins), MCU_Power (71 pins), LCD (13 pins), SDRAM (17 pins), ADC (14 pins), Battery_Charging (30 pins), USB (13 pins), EEPROM (5 pins), RTC (13 pins), SD_Card (C1201.2 C1202.2 C1203.2 J1201.6), 5V_Regulator (8 pins), 3V3_Regulators (23 pins), ESP32 (21 pins), Power_Sense (15 pins), Encoders (8 pins)
VBUS: Battery_Charging (C1405.1 F1401.1), USB (R803.2 TP801.1 U803.4)
VSYS: Battery_Charging (C1408.1 Q1402.3 TP1407.1), 5V_Regulator (C1501.1 L1501.2 U1501.9 U1501.10), 3V3_Regulators (8 pins)
+3V3_V_SENS: 3V3_Regulators (C1608.1 TP1603.1 U1602.1 U1602.4), Power_Sense (U1702.1)
+3V3A_V_SENS: 3V3_Regulators (C1612.1 TP1605.1 U1604.1 U1604.4), Power_Sense (U1702.2)
+5V_SENS: 5V_Regulator (C1504.1 R1505.2 TP1504.1), Power_Sense (U1702.16)
ADC_~{CS}: MCU (U201.D2), ADC (TP634.1 U601.17)
ADC_~{DRDY}: MCU (U201.C1), ADC (TP638.1 U601.18)
ADC_DIN: MCU (U201.E3), ADC (TP635.1 U601.21)
ADC_DOUT: MCU (U201.D3), ADC (TP636.1 U601.20)
ADC_~{SYNC}: MCU (U201.D1), ADC (TP639.1 U601.16)
ADC_SCLK: MCU (U201.C3), ADC (TP637.1 U601.19)
AIN0_N: ADC (TP604.1 U601.30), ADC/CH0 (R703_8.2 R705_8.2)
AIN0_P: ADC (TP602.1 U601.29), ADC/CH0 (R702_8.2 R703_8.1)
AIN1_N: ADC (TP609.1 U601.31), ADC/ADC_Frontend (R703_7.2 R705_7.2)
AIN1_P: ADC (TP607.1 U601.32), ADC/ADC_Frontend (R702_7.2 R703_7.1)
AIN2_N: ADC (TP613.1 U601.2), ADC/ADC_Frontend (R703_6.2 R705_6.2)
AIN2_P: ADC (TP611.1 U601.1), ADC/ADC_Frontend (R702_6.2 R703_6.1)
AIN3_N: ADC (TP617.1 U601.3), ADC/ADC_Frontend (R703_5.2 R705_5.2)
AIN3_P: ADC (TP615.1 U601.4), ADC/ADC_Frontend (R702_5.2 R703_5.1)
AIN4_N: ADC (TP621.1 U601.6), ADC/ADC_Frontend (R703_4.2 R705_4.2)
AIN4_P: ADC (TP619.1 U601.5), ADC/ADC_Frontend (R702_4.2 R703_4.1)
AIN5_N: ADC (TP625.1 U601.7), ADC/ADC_Frontend (R703_3.2 R705_3.2)
AIN5_P: ADC (TP623.1 U601.8), ADC/ADC_Frontend (R702_3.2 R703_3.1)
AIN6_N: ADC (TP629.1 U601.10), ADC/ADC_Frontend (R703_2.2 R705_2.2)
AIN6_P: ADC (TP627.1 U601.9), ADC/ADC_Frontend (R702_2.2 R703_2.1)
AIN7_N: ADC (TP633.1 U601.12), ADC/ADC_Frontend (R703_1.2 R705_1.2)
AIN7_P: ADC (TP631.1 U601.11), ADC/ADC_Frontend (R702_1.2 R703_1.1)
AT_CTS: MCU (U201.J4), ESP32 (TP903.1 U901.10)
AT_RTS: MCU (U201.J2), ESP32 (TP904.1 U901.9)
AT_RX: MCU (U201.H1), ESP32 (TP902.1 U901.12)
AT_TX: MCU (U201.J3), ESP32 (TP901.1 U901.13)
BATT_I_SENS: Battery_Charging (C1401.1 R1401.1 TP1402.1), Power_Sense (U1701.16)
BATT_V_SENS: Battery_Charging (C1403.1 R1403.1 TP1404.1), Power_Sense (U1701.15)
BOOT0: MCU (U201.M1), ESP32 (J902.6 U901.15)
~{CD}: MCU (U201.C9), SD_Card (J1201.9 R1207.2 TP1207.1)
~{CE}: Battery_Charging (R1417.1 TP1408.1 U1406.4), Power_Sense (U1701.5)
~{CHG}: Battery_Charging (R1424.2 TP1409.1 U1406.9), Power_Sense (U1701.4)
CAP_I_SENS: RTC (C1006.1 R1009.2 TP1005.1), Power_Sense (U1702.3)
CAP_V_SENS: RTC (C1007.1 R1010.2 TP1006.1), Power_Sense (U1702.4)
CLK: MCU (U201.L3), SD_Card (R1204.1 TP1204.1)
CMD: MCU (U201.B8), SD_Card (R1203.1 TP1203.1)
DAT0: MCU (U201.A8), SD_Card (R1205.1 TP1205.1)
DAT1: MCU (U201.C8), SD_Card (R1206.1 TP1206.1)
DAT2: MCU (U201.A7), SD_Card (R1201.1 TP1201.1)
DAT3: MCU (U201.B6), SD_Card (R1202.1 TP1202.1)
EEPROM_SCL: MCU (U201.A5), EEPROM (R1102.2 TP1102.1 U1101.6)
EEPROM_SDA: MCU (U201.B5), EEPROM (R1101.2 TP1101.1 U1101.5)
EEPROM_~{WC}: MCU (U201.B4), EEPROM (TP1103.1 U1101.7)
ENC_1_A: MCU (U201.P1), Encoders (R1802.1)
ENC_1_B: MCU (U201.P2), Encoders (R1804.1)
ENC_1_BTN: MCU (U201.L2), Encoders (R1812.1)
ENC_2_A: MCU (U201.R7), Encoders (R1808.1)
ENC_2_B: MCU (U201.N6), Encoders (R1810.1)
ENC_2_BTN: MCU (U201.N4), Encoders (R1806.1)
ESP_PROG_RX: MCU (U201.L15), ESP32 (J902.4 U901.27)
ESP_PROG_TX: MCU (U201.M15), ESP32 (J902.3 U901.28)
ESP_~{RST}: MCU (U201.M2), ESP32 (J902.5 R901.2 U901.7)
HEART_BEAT: MCU (U201.M13), MCU_Peripherals (R408.1 TP408.1)
~{INT}A: MCU (U201.K15), RTC (R1001.2 TP1001.1 U1001.9)
~{INT}B: MCU (U201.K14), RTC (TP1002.1 U1001.4)
IN_1_N: ADC (J601.15 J602.2 TP603.1), ADC/CH0 (R704_8.1)
IN_1_P: ADC (J601.16 J602.1 TP601.1), ADC/CH0 (R701_8.1)
IN_2_N: ADC (J601.13 J602.4 TP608.1), ADC/ADC_Frontend (R704_7.1)
IN_2_P: ADC (J601.14 J602.3 TP605.1), ADC/ADC_Frontend (R701_7.1)
IN_3_N: ADC (J601.11 J602.6 TP612.1), ADC/ADC_Frontend (R704_6.1)
IN_3_P: ADC (J601.12 J602.5 TP610.1), ADC/ADC_Frontend (R701_6.1)
IN_4_N: ADC (J601.9 J602.8 TP616.1), ADC/ADC_Frontend (R704_5.1)
IN_4_P: ADC (J601.10 J602.7 TP614.1), ADC/ADC_Frontend (R701_5.1)
IN_5_N: ADC (J601.7 J602.10 TP620.1), ADC/ADC_Frontend (R704_4.1)
IN_5_P: ADC (J601.8 J602.9 TP618.1), ADC/ADC_Frontend (R701_4.1)
IN_6_N: ADC (J601.5 J602.12 TP624.1), ADC/ADC_Frontend (R704_3.1)
IN_6_P: ADC (J601.6 J602.11 TP622.1), ADC/ADC_Frontend (R701_3.1)
IN_7_N: ADC (J601.3 J602.14 TP628.1), ADC/ADC_Frontend (R704_2.1)
IN_7_P: ADC (J601.4 J602.13 TP626.1), ADC/ADC_Frontend (R701_2.1)
IN_8_N: ADC (J601.1 J602.16 TP632.1), ADC/ADC_Frontend (R704_1.1)
IN_8_P: ADC (J601.2 J602.15 TP630.1), ADC/ADC_Frontend (R701_1.1)
LCD_DISP: MCU (U201.G15), LCD (J1301.31 R1303.1)
LCD_PWM: MCU (U201.D14), LCD (J1301.35)
LCD_RST: MCU (U201.B9), LCD (J1301.39 R1302.1)
LTDC_CLK: MCU (U201.G13), LCD (J1301.30)
LTDC_DE: MCU (U201.K3), LCD (J1301.34)
LTDC_HSYNC: MCU (U201.E14), LCD (J1301.32)
LTDC_VSYNC: MCU (U201.P5), LCD (J1301.33)
OSC_IN: MCU (U201.J1), MCU_Peripherals (C401.1 Y401.3)
OUT_OUT: MCU (U201.K1), MCU_Peripherals (C402.1 Y401.1)
~{PGOOD}: Battery_Charging (TP1410.1 U1406.7), Power_Sense (U1701.3)
PG: 5V_Regulator (TP1502.1 U1501.5), Power_Sense (U1702.15)
~{RST}: MCU_Peripherals (J401.10 R402.2), MCU_Power (TP301.1 U201.L1)
RTC_SCL: MCU (U201.J15), RTC (R1003.2 TP1004.1 U1001.7), Power_Sense (U1701.13 U1702.13)
RTC_SDA: MCU (U201.H15), RTC (R1002.2 TP1003.1 U1001.6), Power_Sense (U1701.14 U1702.14)
SDRAM_CAS: MCU (U201.D7), SDRAM (U501.F7)
SDRAM_CKE: MCU (U201.M7), SDRAM (U501.F3)
SDRAM_CLK: MCU (U201.G12), SDRAM (U501.F2)
SDRAM_CS: MCU (U201.R6), SDRAM (U501.G9)
SDRAM_RAS: MCU (U201.N7), SDRAM (U501.F8)
SDRAM_WE: MCU (U201.R5), SDRAM (U501.F9)
STAT_B: MCU (U201.M14), MCU_Peripherals (R407.1 TP407.1)
STAT_G: MCU (U201.N15), MCU_Peripherals (R406.1 TP406.1)
STAT_R: MCU (U201.P15), MCU_Peripherals (R405.1 TP405.1)
STM_BOOT0: MCU_Peripherals (R404.2), MCU_Power (TP302.1 U201.C5)
SWCLK: MCU (U201.A12), MCU_Peripherals (J401.4 TP402.1)
SWDIO: MCU (U201.B13), MCU_Peripherals (J401.2 TP401.1)
SWO: MCU (U201.A6), MCU_Peripherals (J401.6 TP403.1)
SYS_I_SENS: Battery_Charging (C1402.1 R1402.2 TP1403.1), Power_Sense (U1701.2)
SYS_V_SENS: Battery_Charging (C1404.1 R1411.2 TP1405.1), Power_Sense (U1701.1)
TOUCH_IRQ: MCU (U201.C14), LCD (J1301.40 R1305.2)
TOUCH_SCL: MCU (U201.M11), LCD (J1301.38 R1304.2)
TOUCH_SDA: MCU (U201.E13), LCD (J1301.37 R1301.2)
USB_D_N: MCU (U201.C15), USB (U801.6)
USB_D_P: MCU (U201.B15), USB (U801.4)
VBUS_I_SENS: USB (C803.1 R804.2 TP802.1), Power_Sense (U1702.6)
VBUS_V_SENS: USB (C804.1 R809.2 TP803.1), Power_Sense (U1702.5)